# Altium schematic sheet LoRaModule.SchDoc
size A; SheetNumber: 6; SheetTotal: 6
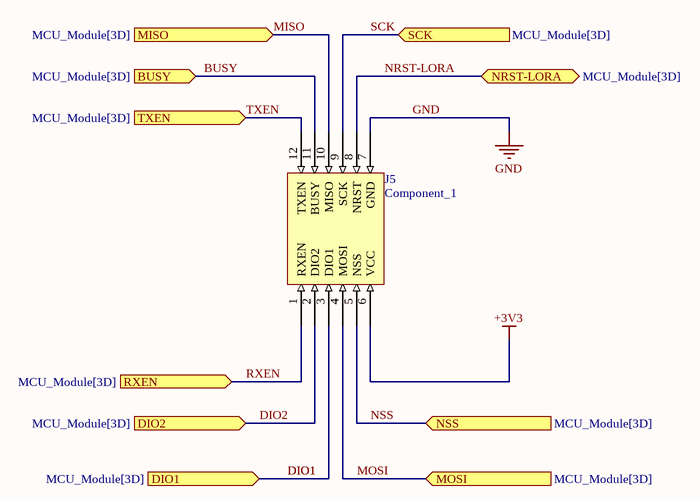
[diagram p0: LoRaModule.SchDoc]

## Parts
J5  Component_1  [DIP12-LoRa-Wireless-Maodule]

## Ports
BUSY (in, see MCU_Module[3D]), DIO1 (in, see MCU_Module[3D]), DIO2 (in, see MCU_Module[3D]), MISO (in, see MCU_Module[3D]), MOSI (in, see MCU_Module[3D]), NRST-LORA (bidir, see MCU_Module[3D]), NSS (in, see MCU_Module[3D]), RXEN (in, see MCU_Module[3D]), SCK (in, see MCU_Module[3D]), TXEN (in, see MCU_Module[3D])

## Nets
+3V3: J5.6(VCC)
GND: J5.7(GND)
BUSY: J5.11(BUSY) ; port BUSY
DIO1: J5.3(DIO1) ; port DIO1
DIO2: J5.2(DIO2) ; port DIO2
MISO: J5.10(MISO) ; port MISO
MOSI: J5.4(MOSI) ; port MOSI
NRST-LORA: J5.8(NRST) ; port NRST-LORA
NSS: J5.5(NSS) ; port NSS
RXEN: J5.1(RXEN) ; port RXEN
SCK: J5.9(SCK) ; port SCK
TXEN: J5.12(TXEN) ; port TXEN